# Altium schematic sheet MENU_BUTTONS_A.SchDoc
size A4; SheetNumber: 6; SheetTotal: 7
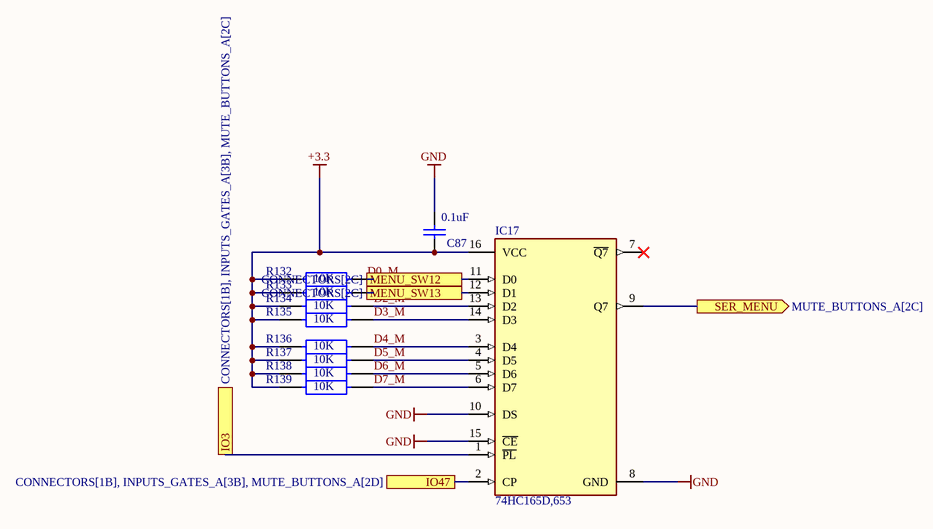
[diagram p0: MENU_BUTTONS_A.SchDoc]

## Parts
C87  0.1uF  [CAPC2013X145X48NL20T23]
IC17  74HC165D,653  [FP-SOT109-1-MFG]
R132  10K  [FP-RN73R2A-IPC_A]
R133  10K  [FP-RN73R2A-IPC_A]
R134  10K  [FP-RN73R2A-IPC_A]
R135  10K  [FP-RN73R2A-IPC_A]
R136  10K  [FP-RN73R2A-IPC_A]
R137  10K  [FP-RN73R2A-IPC_A]
R138  10K  [FP-RN73R2A-IPC_A]
R139  10K  [FP-RN73R2A-IPC_A]

## Ports
IO3 (see CONNECTORS[1B], INPUTS_GATES_A[3B], MUTE_BUTTONS_A[2C]), IO47 (see CONNECTORS[1B], INPUTS_GATES_A[3B], MUTE_BUTTONS_A[2D]), MENU_SW12 (see CONNECTORS[2C]), MENU_SW13 (see CONNECTORS[2C]), SER_MENU (out, see MUTE_BUTTONS_A[2C])

## Nets
+3.3: C87.1 IC17.16(VCC) R132.1 R133.1 R134.1 R135.1 R136.1 R137.1 R138.1 R139.1
GND: C87.2 IC17.8(GND) IC17.10(DS) IC17.15(~{CE})
D0_M: IC17.11(D0) R132.2 ; port MENU_SW12
D1_M: IC17.12(D1) R133.2 ; port MENU_SW13
D2_M: IC17.13(D2) R134.2
D3_M: IC17.14(D3) R135.2
D4_M: IC17.3(D4) R136.2
D5_M: IC17.4(D5) R137.2
D6_M: IC17.5(D6) R138.2
D7_M: IC17.6(D7) R139.2
IO3: IC17.1(~{PL}) ; port IO3
IO47: IC17.2(CP) ; port IO47
SER_MENU: IC17.9(Q7) ; port SER_MENU

Not connected (* = marked no-connect by the designer): IC17 7(~{Q7})*

## Library data of the parts
C87 = CAP: Manufacturer: Vitramon; Part Number: VJ0805Y682KXAMT
IC17 = 74HC165: IC SHIFT REGST 8BIT PI-SO 16SOIC; Manufacturer: Nexperia; Standoff Height: 0.1mm; Number Of Inputs: 8; Logic Function Desc: Shift Register; Nominal Supply Current: 8uA; Number Of Circuits: 1; Propagation Delay: 15ns; Min Supply Voltage: 2V; Frequency: 61MHz; Max Supply Voltage: 6V; Height: 1.75mm; Digikey Description: IC SHIFT REGST 8BIT PI-SO 16SOIC; ComponentLink2URL: https://assets.nexperia.com/documents/data-sheet/74HC_HCT165.pdf; Ipc Land Pattern Name: SOP127P600X175-16; Temperature Range High: +125°C; Manufacturer Part Number: 74HC165D,653; Temperature: -40°C to +125°C; Device Class L2: Logic ICs; Device Class L1: Integrated Circuits (ICs); Lead Free: Yes; Number Of Outputs: 1; Ambient Temperature Range High: +125°C; ComponentLink2Description: Datasheet; Temperature Range Low: -40°C; Category: IC; RoHS: TRUE; Automotive: No; Device Class L3: Shift Registers; Octopart: https://octopart.com/74hc165d%2C653-nexperia-78737091; Footprint Url: https://assets.nexperia.com/documents/outline-drawing/SOT109-1.pdf; Ambient Temperature Range Low: -40°C; Package: SOT109-1
R132-R139 = Resistor: RES 10K OHM 0.1% 1/8W 0805